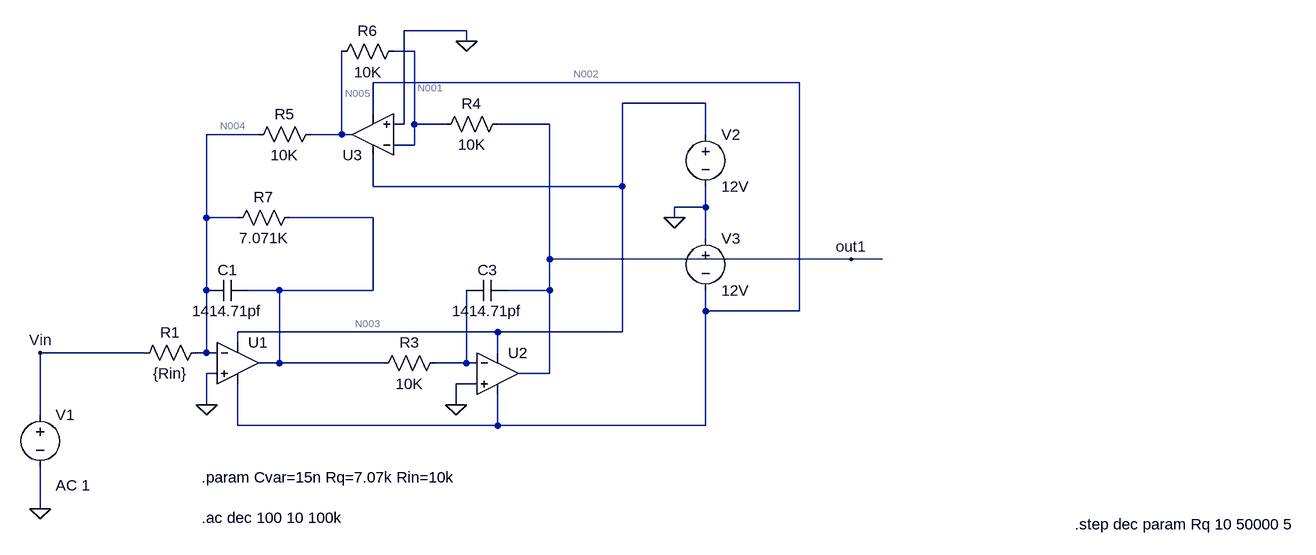
[diagram p0: schematic vcf.asc]
vcf.asc, the LTspice schematic file:
Version 4.1
SHEET 1 2568 680
WIRE 592 -336 496 -336
WIRE 592 -320 592 -336
WIRE 512 -304 480 -304
WIRE 1104 -256 448 -256
WIRE 960 -224 832 -224
WIRE 448 -208 448 -256
WIRE 496 -192 496 -336
WIRE 496 -192 480 -192
WIRE 512 -192 512 -304
WIRE 560 -192 512 -192
WIRE 720 -192 640 -192
WIRE 272 -176 192 -176
WIRE 400 -176 400 -304
WIRE 400 -176 352 -176
WIRE 416 -176 400 -176
WIRE 960 -176 960 -224
WIRE 512 -160 512 -192
WIRE 512 -160 480 -160
WIRE 448 -96 448 -144
WIRE 832 -96 832 -224
WIRE 832 -96 448 -96
WIRE 960 -64 960 -96
WIRE 960 -64 912 -64
WIRE 192 -48 192 -176
WIRE 240 -48 192 -48
WIRE 448 -48 320 -48
WIRE 912 -48 912 -64
WIRE 960 -16 960 -64
WIRE 720 16 720 -192
WIRE 1184 16 720 16
WIRE 1232 16 1184 16
WIRE 192 64 192 -48
WIRE 304 64 256 64
WIRE 448 64 448 -48
WIRE 448 64 304 64
WIRE 720 64 720 16
WIRE 720 64 656 64
WIRE 960 96 960 64
WIRE 1104 96 1104 -256
WIRE 1104 96 960 96
WIRE 640 128 240 128
WIRE 832 128 832 -96
WIRE 832 128 640 128
WIRE 240 144 240 128
WIRE 96 160 -64 160
WIRE 192 160 192 64
WIRE 192 160 176 160
WIRE 208 160 192 160
WIRE 640 160 640 128
WIRE 304 176 304 64
WIRE 304 176 272 176
WIRE 464 176 304 176
WIRE 592 176 592 64
WIRE 592 176 544 176
WIRE 608 176 592 176
WIRE 208 192 192 192
WIRE 720 192 720 64
WIRE 720 192 672 192
WIRE 608 208 576 208
WIRE 192 240 192 192
WIRE 576 240 576 208
WIRE -64 256 -64 160
WIRE 240 272 240 208
WIRE 640 272 640 224
WIRE 640 272 240 272
WIRE 960 272 960 96
WIRE 960 272 640 272
WIRE -64 400 -64 336
FLAG -64 400 0
FLAG 912 -48 0
FLAG 192 240 0
FLAG 576 240 0
FLAG 592 -320 0
FLAG -64 160 Vin
FLAG 1184 16 out1
SYMBOL OpAmps\\UniversalOpAmp 240 176 R0
SYMATTR InstName U1
SYMBOL OpAmps\\UniversalOpAmp 640 192 R0
SYMATTR InstName U2
SYMBOL OpAmps\\UniversalOpAmp 448 -176 R180
SYMATTR InstName U3
SYMBOL res 560 160 R90
WINDOW 0 0 56 VBottom 2
WINDOW 3 32 56 VTop 2
SYMATTR InstName R3
SYMATTR Value 10K
SYMBOL cap 256 48 R90
WINDOW 0 0 32 VBottom 2
WINDOW 3 32 32 VTop 2
SYMATTR InstName C1
SYMATTR Value 1414.71pf
SYMBOL voltage -64 240 R0
WINDOW 123 24 124 Left 2
WINDOW 39 0 0 Left 0
SYMATTR Value2 AC 1
SYMATTR InstName V1
SYMATTR Value ""
SYMBOL cap 656 48 R90
WINDOW 0 0 32 VBottom 2
WINDOW 3 32 32 VTop 2
SYMATTR InstName C3
SYMATTR Value 1414.71pf
SYMBOL res 656 -208 R90
WINDOW 0 0 56 VBottom 2
WINDOW 3 32 56 VTop 2
SYMATTR InstName R4
SYMATTR Value 10K
SYMBOL res 368 -192 R90
WINDOW 0 0 56 VBottom 2
WINDOW 3 32 56 VTop 2
SYMATTR InstName R5
SYMATTR Value 10K
SYMBOL res 496 -320 R90
WINDOW 0 0 56 VBottom 2
WINDOW 3 32 56 VTop 2
SYMATTR InstName R6
SYMATTR Value 10K
SYMBOL voltage 960 -192 R0
SYMATTR InstName V2
SYMATTR Value 12V
SYMBOL voltage 960 -32 R0
SYMATTR InstName V3
SYMATTR Value 12V
SYMBOL res 192 144 R90
WINDOW 0 0 56 VBottom 2
WINDOW 3 32 56 VTop 2
SYMATTR InstName R1
SYMATTR Value {Rin}
SYMBOL res 336 -64 R90
WINDOW 0 0 56 VBottom 2
WINDOW 3 32 56 VTop 2
SYMATTR InstName R7
SYMATTR Value 7.071K
TEXT 184 352 Left 2 !.param Cvar=15n Rq=7.07k Rin=10k\n\n.ac dec 100 10 100k
TEXT 1528 424 Left 2 !.step dec param Rq 10 50000 5

The netlist it stands for:
* vcf.asc
X§U1 0 N004 N003 N002 N006 level1 Avol=1Meg GBW=10Meg Vos=0 En=0 Enk=0 In=0 Ink=0 Rin=500Meg  ; pins In+ In- V+ V- OUT
X§U2 0 N007 N003 N002 out1 level1 Avol=1Meg GBW=10Meg Vos=0 En=0 Enk=0 In=0 Ink=0 Rin=500Meg  ; pins In+ In- V+ V- OUT
X§U3 0 N001 N003 N002 N005 level1 Avol=1Meg GBW=10Meg Vos=0 En=0 Enk=0 In=0 Ink=0 Rin=500Meg  ; pins In+ In- V+ V- OUT
R3 N007 N006 10K
C1 N006 N004 1414.71pf
V1 Vin 0 AC 1
C3 out1 N007 1414.71pf
R4 out1 N001 10K
R5 N005 N004 10K
R6 N001 N005 10K
V2 N003 0 12V
V3 0 N002 12V
R1 N004 Vin {Rin}
R7 N006 N004 7.071K
.param Cvar=15n Rq=7.07k Rin=10k
.ac dec 100 10 100k
.step dec param Rq 10 50000 5
.lib UniversalOpAmp1.lib
.backanno
.end

* Results of the author's LTspice run, read from the files saved beside the schematic
* Operating Point (first step), zero values left out:
*   V(n002) = -12 V
*   V(n003) = 12 V
*   I(V2) = -72 nA
*   I(V3) = -72 nA
*   Ix(u1:3) = 24 nA
*   Ix(u1:4) = -24 nA
*   Ix(u2:3) = 24 nA
*   Ix(u2:4) = -24 nA
*   Ix(u3:3) = 24 nA
*   Ix(u3:4) = -24 nA
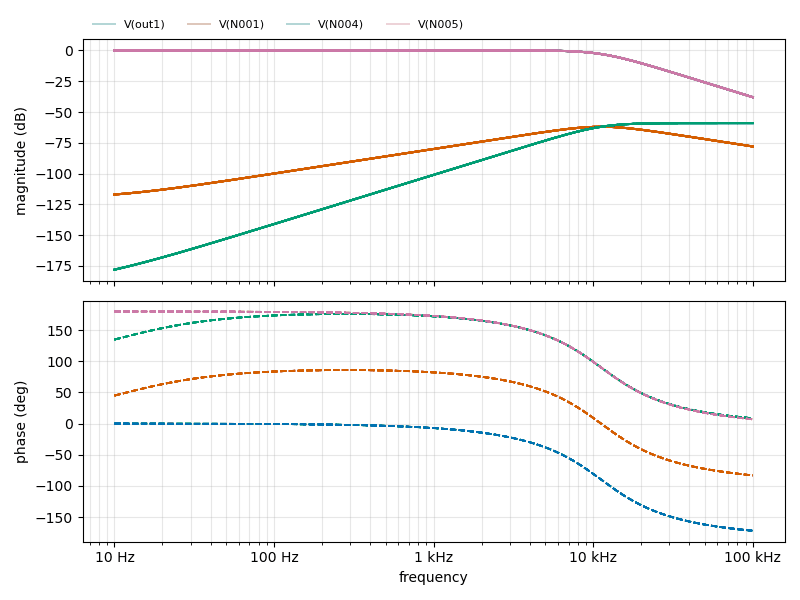
[diagram p1: AC Analysis of vcf.asc, plotted from the saved traces]
* AC Analysis, 20 runs:
*   V(out1) [run 1]: 0.00 dB at 10 Hz, -37.98 dB at 100 kHz, peak 0.00 dB at 977.2 Hz, 3 dB below the peak at 11.27 kHz
*   V(out1) [run 2]: 0.00 dB at 10 Hz, -37.98 dB at 100 kHz, peak 0.00 dB at 977.2 Hz, 3 dB below the peak at 11.27 kHz
*   V(out1) [run 3]: 0.00 dB at 10 Hz, -37.98 dB at 100 kHz, peak 0.00 dB at 977.2 Hz, 3 dB below the peak at 11.27 kHz
*   V(out1) [run 4]: 0.00 dB at 10 Hz, -37.98 dB at 100 kHz, peak 0.00 dB at 977.2 Hz, 3 dB below the peak at 11.27 kHz
*   V(out1) [run 5]: 0.00 dB at 10 Hz, -37.98 dB at 100 kHz, peak 0.00 dB at 977.2 Hz, 3 dB below the peak at 11.27 kHz
*   V(out1) [run 6]: 0.00 dB at 10 Hz, -37.98 dB at 100 kHz, peak 0.00 dB at 977.2 Hz, 3 dB below the peak at 11.27 kHz
*   V(out1) [run 7]: 0.00 dB at 10 Hz, -37.98 dB at 100 kHz, peak 0.00 dB at 977.2 Hz, 3 dB below the peak at 11.27 kHz
*   V(out1) [run 8]: 0.00 dB at 10 Hz, -37.98 dB at 100 kHz, peak 0.00 dB at 977.2 Hz, 3 dB below the peak at 11.27 kHz
*   V(N001) [run 1]: -116.99 dB at 10 Hz, -77.99 dB at 100 kHz, peak -61.97 dB at 11.22 kHz, 3 dB below the peak at 5.826 kHz and 21.65 kHz
*   V(N001) [run 2]: -116.99 dB at 10 Hz, -77.99 dB at 100 kHz, peak -61.97 dB at 11.22 kHz, 3 dB below the peak at 5.826 kHz and 21.65 kHz
*   V(N001) [run 3]: -116.99 dB at 10 Hz, -77.99 dB at 100 kHz, peak -61.97 dB at 11.22 kHz, 3 dB below the peak at 5.826 kHz and 21.65 kHz
*   V(N001) [run 4]: -116.99 dB at 10 Hz, -77.99 dB at 100 kHz, peak -61.97 dB at 11.22 kHz, 3 dB below the peak at 5.826 kHz and 21.65 kHz
*   V(N001) [run 5]: -116.99 dB at 10 Hz, -77.99 dB at 100 kHz, peak -61.97 dB at 11.22 kHz, 3 dB below the peak at 5.826 kHz and 21.65 kHz
*   V(N001) [run 6]: -116.99 dB at 10 Hz, -77.99 dB at 100 kHz, peak -61.97 dB at 11.22 kHz, 3 dB below the peak at 5.826 kHz and 21.65 kHz
*   V(N001) [run 7]: -116.99 dB at 10 Hz, -77.99 dB at 100 kHz, peak -61.97 dB at 11.22 kHz, 3 dB below the peak at 5.826 kHz and 21.65 kHz
*   V(N001) [run 8]: -116.99 dB at 10 Hz, -77.99 dB at 100 kHz, peak -61.97 dB at 11.22 kHz, 3 dB below the peak at 5.826 kHz and 21.65 kHz
*   V(N004) [run 1]: -178.00 dB at 10 Hz, -59.00 dB at 100 kHz, peak -59.00 dB at 100 kHz, 3 dB below the peak at 11.19 kHz
*   V(N004) [run 2]: -178.00 dB at 10 Hz, -59.00 dB at 100 kHz, peak -59.00 dB at 100 kHz, 3 dB below the peak at 11.19 kHz
*   V(N004) [run 3]: -178.00 dB at 10 Hz, -59.00 dB at 100 kHz, peak -59.00 dB at 100 kHz, 3 dB below the peak at 11.19 kHz
*   V(N004) [run 4]: -178.00 dB at 10 Hz, -59.00 dB at 100 kHz, peak -59.00 dB at 100 kHz, 3 dB below the peak at 11.19 kHz
*   V(N004) [run 5]: -178.00 dB at 10 Hz, -59.00 dB at 100 kHz, peak -59.00 dB at 100 kHz, 3 dB below the peak at 11.19 kHz
*   V(N004) [run 6]: -178.00 dB at 10 Hz, -59.00 dB at 100 kHz, peak -59.00 dB at 100 kHz, 3 dB below the peak at 11.19 kHz
*   V(N004) [run 7]: -178.00 dB at 10 Hz, -59.00 dB at 100 kHz, peak -59.00 dB at 100 kHz, 3 dB below the peak at 11.19 kHz
*   V(N004) [run 8]: -178.00 dB at 10 Hz, -59.00 dB at 100 kHz, peak -59.00 dB at 100 kHz, 3 dB below the peak at 11.19 kHz
*   V(N005) [run 1]: -0.00 dB at 10 Hz, -37.99 dB at 100 kHz, peak 0.00 dB at 977.2 Hz, 3 dB below the peak at 11.27 kHz
*   V(N005) [run 2]: -0.00 dB at 10 Hz, -37.99 dB at 100 kHz, peak 0.00 dB at 977.2 Hz, 3 dB below the peak at 11.27 kHz
*   V(N005) [run 3]: -0.00 dB at 10 Hz, -37.99 dB at 100 kHz, peak 0.00 dB at 977.2 Hz, 3 dB below the peak at 11.27 kHz
*   V(N005) [run 4]: -0.00 dB at 10 Hz, -37.99 dB at 100 kHz, peak 0.00 dB at 977.2 Hz, 3 dB below the peak at 11.27 kHz
*   V(N005) [run 5]: -0.00 dB at 10 Hz, -37.99 dB at 100 kHz, peak 0.00 dB at 977.2 Hz, 3 dB below the peak at 11.27 kHz
*   V(N005) [run 6]: -0.00 dB at 10 Hz, -37.99 dB at 100 kHz, peak 0.00 dB at 977.2 Hz, 3 dB below the peak at 11.27 kHz
*   V(N005) [run 7]: -0.00 dB at 10 Hz, -37.99 dB at 100 kHz, peak 0.00 dB at 977.2 Hz, 3 dB below the peak at 11.27 kHz
*   V(N005) [run 8]: -0.00 dB at 10 Hz, -37.99 dB at 100 kHz, peak 0.00 dB at 977.2 Hz, 3 dB below the peak at 11.27 kHz